# Altium project PitchShifter.PrjPcb (part 1 of 2)
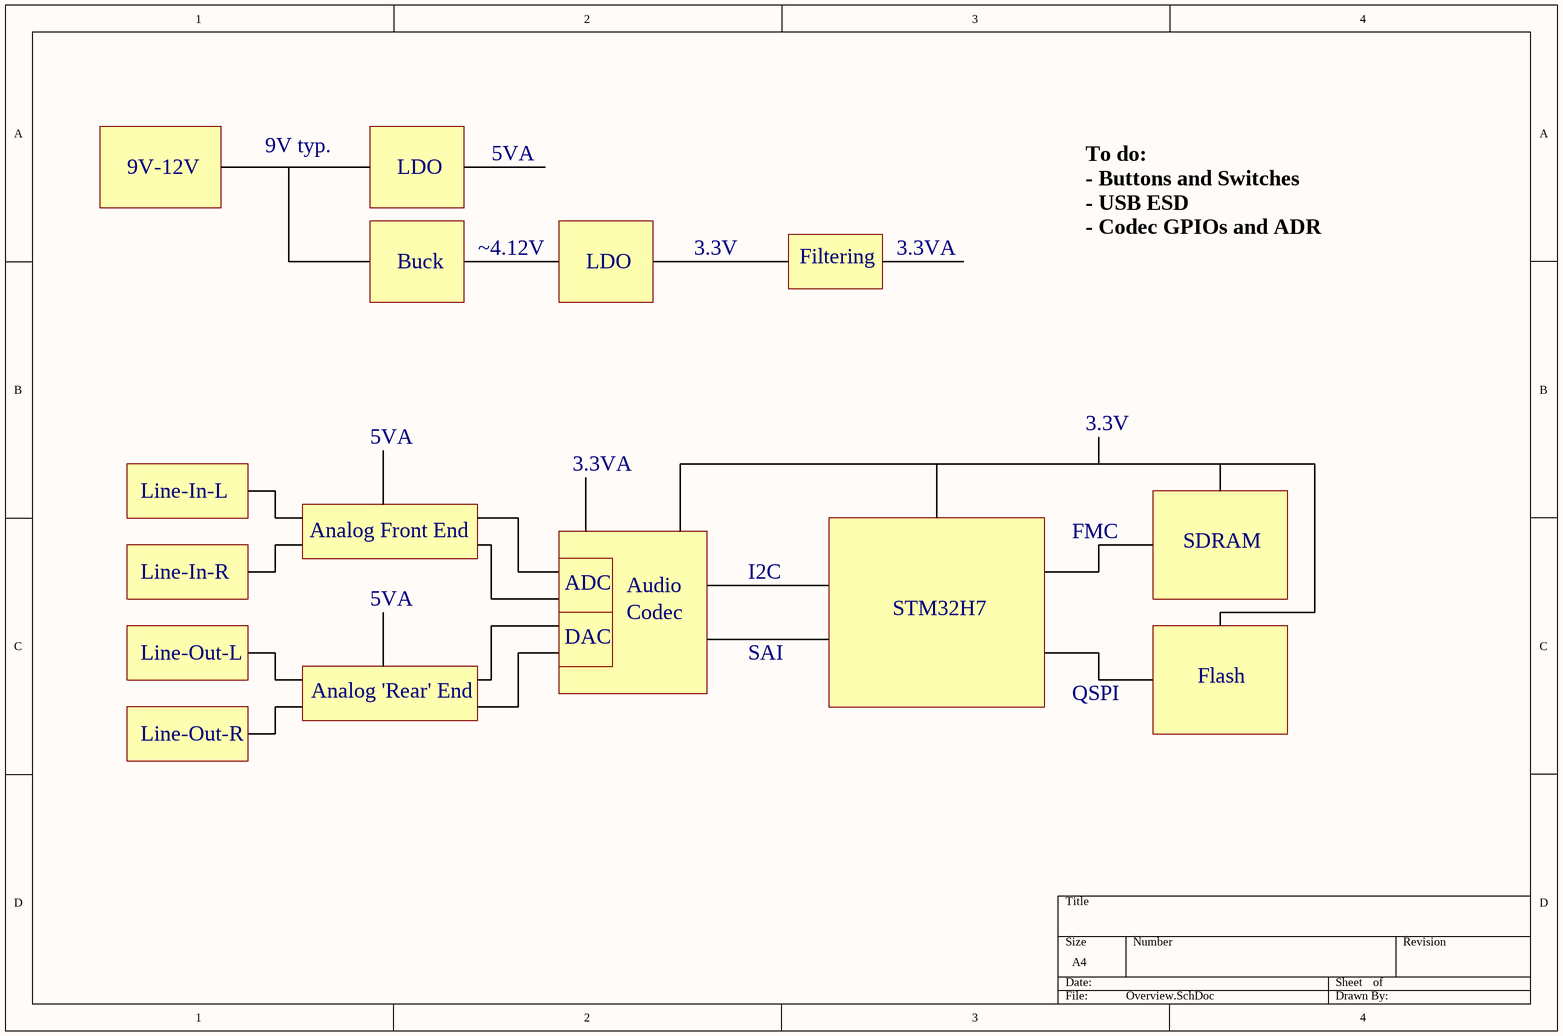
[diagram p0: Overview.SchDoc]
8 sheets, 248 parts. Net scope: global (net labels, ports and power ports of the same name join across sheets).
Board file: PitchShifter-PCB.PcbDoc
Sheets:
  Overview.SchDoc
  Analogue_IN.SchDoc
  Analogue_OUT.SchDoc
  Power.SchDoc
  MCU.SchDoc
  Codec.SchDoc
  Memory.SchDoc
  Peripherals.SchDoc

## Sheet Overview.SchDoc
size A4; SheetNumber: 1; SheetTotal: 8

### Notes on the sheet
- 9V-12V
- 9V typ.
- LDO
- 5VA
- Buck
- ~4.12V
- 3.3V
- Filtering
- 3.3VA
- To do:
  - Buttons and Switches
  - USB ESD
  - Codec GPIOs and ADR
- Line-In-L
- Line-In-R
- Analog Front End
- I2C
- FMC
- SDRAM
- ADC
- DAC
- Audio
- Codec
- STM32H7
- Line-Out-L
- Analog 'Rear' End
- SAI
- QSPI
- Flash
- Line-Out-R

## Sheet Analogue_IN.SchDoc
size A4; SheetNumber: 2; SheetTotal: 8; SPICEModelCacheHWMVXXES: <root> / <DocumentId>HWMVXXES</DocumentId> / <CacheFrame Number="0"> / <Model Name="mcp6001" Kind="CKT"> / <Text>.SUBCKT MCP6001 1 2 3 4 5 / *               | | | | | / *               | | | | Output / *               | | | Negative Supply / *               | | Positive Supply / *               | Inverting Input / *               Non-inverting Input / * / ******************************************************************************** / * Software License Agreement                                                   * / *                                                                              * / * The software supplied herewith by Microchip Technology Incorporated (the     * / * "Company") is intended and supplied to you, the Company's customer, for use  * / * soley and exclusively on Microchip products.                                 * / *                                                                              * / * The software is owned by the Company and/or its supplier, and is protected   * / * under applicable copyright laws. All rights are reserved. Any use in         * / * violation of the foregoing restrictions may subject the user to criminal     * / * sanctions under applicable laws, as well as to civil liability for the       * / * breach of the terms and conditions of this license.                          * / *                                                                              * / * THIS SOFTWARE IS PROVIDED IN AN "AS IS" CONDITION. NO WARRANTIES, WHETHER    * / * EXPRESS, IMPLIED OR STATUTORY, INCLUDING, BUT NOT LIMITED TO, IMPLIED        * / * WARRANTIES OF MERCHANTABILITY AND FITNESS FOR A PARTICULAR PURPOSE APPLY TO  * / * THIS SOFTWARE. THE COMPANY SHALL NOT, IN ANY CIRCUMSTANCES, BE LIABLE FOR    * / * SPECIAL, INCIDENTAL OR CONSEQUENTIAL DAMAGES, FOR ANY REASON WHATSOEVER.     * / ******************************************************************************** / * / * Macromodel for the MCP6001/2/4 op amp family: / *   MCP6001, MCP6001R, MCP6001U, MCP6002, MCP6004 / * / * Revision History: / *   REV A: 21-Jun-02, Created model / *   REV B: 16-Jul-02, Improved output stage / *   REV C: 03-Jan-03, Added MCP6001 / *   REV D: 19-Aug-06, Added over temperature, improved output stage, / *                     fixed overdrive recovery time / *   REV E: 27-Jul-07, Updated output impedance for better model stability w/cap load / *   REV F: 09-Jul-12, Added MCP6001R, MCP6001U / * / * Recommendations: / *   Use PSPICE (other simulators may require translation) / *   For a quick, effective design, use a combination of: data sheet / *     specs, bench testing, and simulations with this macromodel / *   For high impedance circuits, set GMIN=100F in .OPTIONS / * / * Supported: / *   Typical performance for temperature range (-40 to 125) degrees Celsius / *   DC, AC, Transient, and Noise analyses. / *   Most specs, including: offsets, DC PSRR, DC CMRR, input impedance, / *     open loop gain, voltage ranges, supply current, ... , etc. / *   Temperature effects for Ibias, Iquiescent, Iout short circuit / *   current, Vsat on both rails, Slew Rate vs. Temp and P.S. / * / * Not Supported: / *   Some Variation in specs vs. Power Supply Voltage / *   Monte Carlo (Vos, Ib), Process variation / *   Distortion (detailed non-linear behavior) / *   Behavior outside normal operating region / * / * Input Stage / V10  3 10 -500M / R10 10 11 6.90K / R11 10 12 6.90K / C11 11 12 0.2p / C12 1  0 6.00P / E12 71 14 POLY(4) 20 0 21 0 26 0 27 0   1.00M 20.1 20.1 1 1 / G12 1 0 62 0 1m / M12 11 14 15 15 NMI L=2.00U W=42.0U / M14 12  2 15 15 NMI L=2.00U W=42.0U / G14 2 0 62 0 1m / C14  2  0 6.00P / I15 15  4 50.0U / V16 16  4 -300M / GD16 16 1 TABLE {V(16,1)} ((-100,-1p)(0,0)(1m,1n)(2m,1m)(3m,1)) / V13  3 13 -300M / GD13 2 13 TABLE {V(2,13)} ((-100,-1p)(0,0)(1m,1n)(2m,1m)(3m,1)) / R70 1 0 20.6T / R71 2 0 20.6T / R72 1 2 20T / I80 1 2 0.5p / * / * Noise, PSRR, and CMRR / I20 21 20 423U / D20 20  0 DN1 / D21  0 21 DN1 / G26  0 26 POLY(1) 3 4   110U -49U / R26 26  0 1 / G27  0 27 POLY(2) 1 0 2 0   -440U 39.7U 39.7U / R27 27  0 1 / * / * Open Loop Gain, Slew Rate / G30  0 30 POLY(1) 12 11   0 1 / R30 30  0 1K / G31  0 31 POLY(1) 3 4 86 5.25 / R31 31  0 1 TC=2.8m / GD31 30 31 TABLE {V(30,31)} ((-11,-1)(-10,-10n)(0,0)(1m,1000)) / G32 32  0 POLY(1) 3 4 113.7 3.5 / R32 32  0 1 TC=2.65m / GD32 30 32 TABLE {V(30,32)} ((-1m,-1000)(0,0)(10,10n)(11,1)) / G33 0 33 30 0 1m / R33 33 0 1k / G34  0 34 33 0 425M / R34  34 0 1K / C34  34 0 74U / G37  0 37 34 0 1m / R37  37 0 1K / C37  37 0 41.6P / G38  0 38 37 0 1m / R38  39 0 1K / L38  38 39 100U / E38  35 0 38 0 1 / G35 33 0 TABLE {V(35,3)} ((-1,-1n)(0,0)(16,1n))(16.1,1)) / G36 33 0 TABLE {V(35,4)} ((-16.1,-1)((-16,-1n)(0,0)(1,1n)) / * / * Output Stage / R80 50 0 100MEG / G50 0 50 57 96 2 / R58 57  96 0.50 / R57 57  0 750 / C58  5  0 2.00P / G57  0 57 POLY(3) 3 0 4 0 35 0   0 0.67M 0.67M 1.5M / GD55 55 57 TABLE {V(55,57)} ((-2m,-1)(-1m,-1m)(0,0)(10,1n)) / GD56 57 56 TABLE {V(57,56)} ((-2m,-1)(-1m,-1m)(0,0)(10,1n)) / E55 55  0 POLY(2) 3 0 51 0 -0.7m 1 -40.0M / E56 56  0 POLY(2) 4 0 52 0 1.2m 1 -37.0M / R51 51 0 1k / R52 52 0 1k / GD51 50 51 TABLE {V(50,51)} ((-10,-1n)(0,0)(1m,1m)(2m,1)) / GD52 50 52 TABLE {V(50,52)} ((-2m,-1)(-1m,-1m)(0,0)(10,1n)) / G53  3  0 POLY(1) 51 0  -49U 1M / G54  0  4 POLY(1) 52 0  -49U -1M / * / * Current Limit / G99 96 5 99 0 1 / R98 0 98 1 TC=-2.8M,2.63U / G97 0 98 TABLE { V(96,5) } ((-11.0,-10.0M)(-1.00M,-9.9M)(0,0)(1.00M,9.9M)(11.0,10.0M)) / E97 99 0 VALUE { V(98)*((V(3)-V(4))*359M + 310M)} / D98 4 5 DESD / D99 5 3 DESD / * / * Temperature / Voltage Sensitive IQuiscent / R61 0 61 100 TC 3.11M 4.51U / G61 3 4 61 0 1 / G60 0 61 TABLE {V(3, 4)} / + ((0,0)(900M,0.0106U)(1.00,0.20U)(1.3,0.63U) / + (1.5,0.66U)(1.6,1.06U)(5.5,1.10U)) / * / * Temp Sensitive offset voltage / I73 0 70 DC 1uA / R74 0 70 1 TC=2 / E75 1 71 70 0 1 / * / * Temp Sensistive IBias / I62 0 62 DC 1uA / R62 0 62 REXP 58.2u / * Voltage on R62 used for G12, G14 in input stage / * / * Models / .MODEL NMI NMOS / .MODEL DESD  D   N=1 IS=1.00E-15 / .MODEL DL  D   N=1 IS=1F / .MODEL DN1 D   IS=1P KF=146E-18 AF=1 / .MODEL REXP RES TCE=10.1 / .ENDS MCP6001</Text> / </Model> / </CacheFrame> / </root>
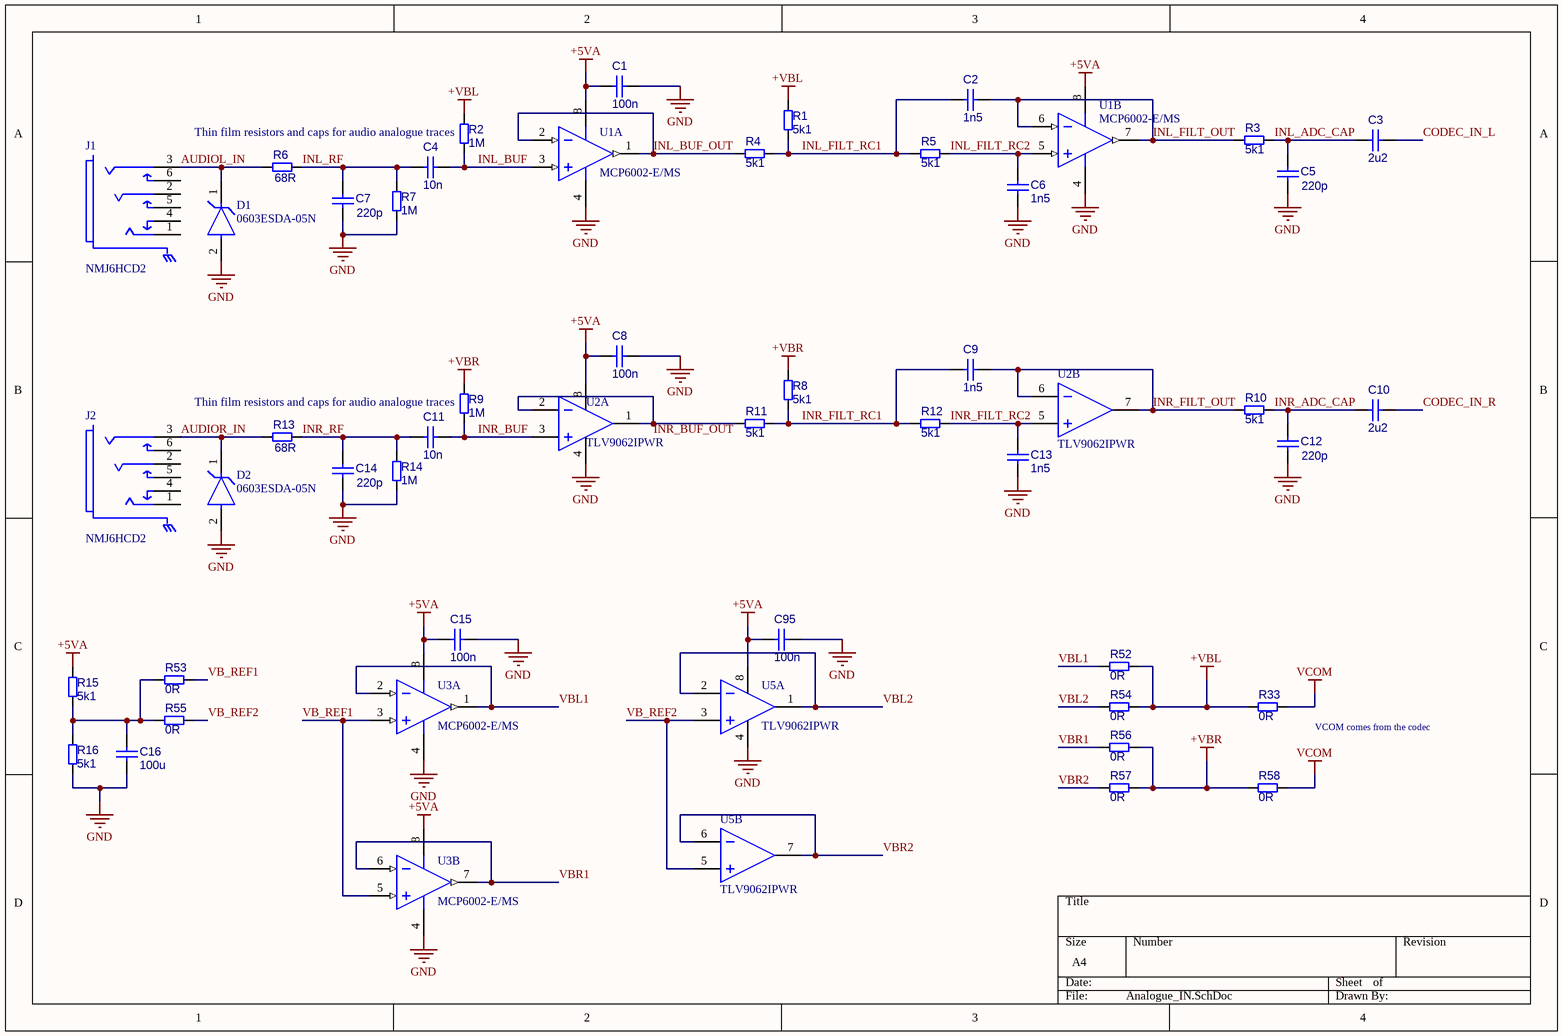
[diagram p1: Analogue_IN.SchDoc]

### Parts
C1  100n  [CAPC1005X50N_0402]
C2  1n5  [C_0402]
C3  2u2  [C_0402]
C4  10n  [C_0402]
C5  220p  [C_0402]
C6  1n5  [C_0402]
C7  220p  [C_0402]
C8  100n  [CAPC1005X50N_0402]
C9  1n5  [C_0402]
C10  2u2  [C_0402]
C11  10n  [C_0402]
C12  220p  [C_0402]
C13  1n5  [C_0402]
C14  220p  [C_0402]
C15  100n  [CAPC1005X50N_0402]
C16  100u  [C_1210]
C95  100n  [CAPC1005X50N_0402]
D1  0603ESDA-05N  [FP-1610-MFG]
D2  0603ESDA-05N  [FP-1610-MFG]
J1  NMJ6HCD2  [FP-NMJ6HCD2-MFG]
J2  NMJ6HCD2  [FP-NMJ6HCD2-MFG]
R1  5k1  [R_0603]
R2  1M  [R_0603]
R3  5k1  [R_0603]
R4  5k1  [R_0603]
R5  5k1  [R_0603]
R6  68R  [R_0603]
R7  1M  [R_0603]
R8  5k1  [R_0603]
R9  1M  [R_0603]
R10  5k1  [R_0603]
R11  5k1  [R_0603]
R12  5k1  [R_0603]
R13  68R  [R_0603]
R14  1M  [R_0603]
R15  5k1  [R_0603]
R16  5k1  [R_0603]
R33  0R  [R_0603]
R52  0R  [R_0603]
R53  0R  [R_0603]
R54  0R  [R_0603]
R55  0R  [R_0603]
R56  0R  [R_0603]
R57  0R  [R_0603]
R58  0R  [R_0603]
U1  MCP6002-E/MS  [MSOP-MS8_M]  (parts A,B of 2)
U2  TLV9062IPWR  [TSSOP-8_TLV9062IPWR]  (parts A,B of 2)
U3  MCP6002-E/MS  [MSOP-MS8_M]  (parts A,B of 2)
U5  TLV9062IPWR  [TSSOP-8_TLV9062IPWR]  (parts A,B of 2)

### Nets
+5VA: C1.1 C8.1 C15.1 C95.1 R15.2 U1.8(VDD) U2.8(-IN) U3.8(VDD) U5.8(-IN)
+VBL: R1.1 R2.2 R33.2 R52.1 R54.1
+VBR: R8.1 R9.2 R56.1 R57.1 R58.2
GND: C1.2 C5.1 C6.2 C7.1 C8.2 C12.1 C13.2 C14.1 C15.2 C16.2 C95.2 D1.2(A) D2.2(A) R7.1 R14.1 R16.1 U1.4(VSS) U2.4(-IN) U3.4(VSS) U5.4(-IN)
VCOM: R33.1 R58.1
AUDIOL_IN: D1.1(C) J1.3(S) R6.1
AUDIOR_IN: D2.1(C) J2.3(S) R13.1
CODEC_IN_L: C3.1
CODEC_IN_R: C10.1
INL_ADC_CAP: C3.2 C5.2 R3.1
INL_BUF: C4.1 R2.1 U1.3(VINA+)
INL_BUF_OUT: R4.2 U1.1(VOUTA) U1.2(VINA-)
INL_FILT_OUT: C2.1 R3.2 U1.6(VINB-) U1.7(VOUTB)
INL_FILT_RC1: C2.2 R1.2 R4.1 R5.1
INL_FILT_RC2: C6.1 R5.2 U1.5(VINB+)
INL_RF: C4.2 C7.2 R6.2 R7.2
INR_ADC_CAP: C10.2 C12.2 R10.1
INR_BUF: C11.1 R9.1 U2.3(OUT)
INR_FILT_OUT: C9.1 R10.2 U2.6(+IN) U2.7(-IN)
INR_FILT_RC1: C9.2 R8.2 R11.1 R12.1
INR_FILT_RC2: C13.1 R12.2 U2.5(OUT)
INR_RF: C11.2 C14.2 R13.2 R14.2
VB_REF1: R53.1 U3.3(VINA+) U3.5(VINB+)
VB_REF2: R55.1 U5.3(OUT) U5.5(OUT)
VBL1: R52.2 U3.1(VOUTA) U3.2(VINA-)
VBL2: R54.2 U5.1(-IN) U5.2(+IN)
VBR1: R56.2 U3.6(VINB-) U3.7(VOUTB)
VBR2: R57.2 U5.6(+IN) U5.7(-IN)
NetC16_1: C16.1 R15.1 R16.2 R53.2 R55.2
NetR11_2: R11.2 U2.1(-IN) U2.2(+IN)

Not connected (* = marked no-connect by the designer): J1 1(T) 2(R) 4(TN) 5(RN) 6(SN); J2 1(T) 2(R) 4(TN) 5(RN) 6(SN)

### Notes on the sheet
- (near R2) Thin film resistors and caps for audio analogue traces
- (near R9) Thin film resistors and caps for audio analogue traces
- (near R33) VCOM comes from the codec
- Labels drawn without touching a wire or pin: INR_BUF_OUT

### Library data of the parts
C1 C8 C15 C95 = CMP-001-00084-2: MLCC 0402 50V / Samsung CL05B104KB54PNC
C2 C6 C9 C13 = CMP-001-00085-2: MLCC 0603 50V / Samsung CL10C152JB8NNNC
C3 C10 = CMP-001-00085-2: Capacitor SMD Tantalum 0603 50V / Kyocera AVX F981C225MMA
C4 C11 = CMP-001-00085-2: MLCC 0603 50V / TDK C1608C0G1H103JT000N
C5 C7 C12 C14 = CMP-001-00085-2: MLCC 0603 50V / Samsung CL10C221JB8NNNC
C16 = CMP-001-00088-1: MLCC 1210 10V / Samsung CL32A107MQVNNNE
D1 D2 = CMP-12225-000013-1: BORN 0603ESDA-05N Diode TVS / ESD Bidirectional 0603; Manufacturer: STMicroelectronics; Manufacturer Part Number: ESDA7P60-1U1M; Number Of Channels: 1; Standoff Height: 0mm; Breakdown Voltage: 6.4V; Direction: Unidirectional; Clamping Voltage: 10.2V; Peak Pulse Power: 700W; Peak Pulse Current: 60A; Reverse Standoff Voltage: 5V; Max Junction Temp: +150°C; ComponentLink2Description: Datasheet; Temperature Range Low: -55°C; Package: 1610; Lead Free: Yes; Temperature Range High: +150°C; Temperature: -55°C to +150°C; Device Class L2: TVS Diodes; Category: Diode; Device Class L1: Circuit Protection; Digikey Description: TVS DIODE 5V 11.6V 1610; ComponentLink2URL: http://www.st.com/content/ccc/resource/technical/document/datasheet/44/e9/26/44/42/ee/4f/e5/DM00139972.pdf/files/DM00139972.pdf/jcr:content/translations/en.DM00139972.pdf; RoHS: TRUE; Octopart: https://octopart.com/esda7p60-1u1m-stmicroelectronics-52112702; Height: 0.65mm; Device Class L3: unset; Automotive: No
J1 J2 = CMP-78736-000004-1: Conn 1/4" Stereo Jack F 2 POS Solder ST Thru-Hole 6 Terminal 1 Port; Number of Ports: 1; Max Current Rating: 3A; Number of Contacts: 2; Number of Terminals/Pins: 6; Gender: Female; Voltage Rating: 50V; Contact Plating: Silver; Mount: Through Hole; RoHS Compliant: Yes; Series: M; Orientation: Horizontal; Number of Pins: 6; Weight: 0.282192oz; Housing Material: Polyamide; Depth: 18.2mm; Max Operating Temperature: 70°C; Termination: Through Hole; Color: Black; Min Operating Temperature: -25°C; Contact Material: Chrome; Package Quantity: 200
R1 R3-R5 R8 R10-R12 R15 R16 = CMP-009-00177-7: Chip THIN FILM 0603 / Viking Tech ARG03FTC5101
R2 R7 R9 R14 = CMP-009-00177-7: Chip THIN FILM 0603 / Viking Tech AR03FTC1004
R6 R13 = CMP-009-00177-7: Chip THIN FILM 0603 / Resistor.Today HPCR0603F68R0K9
R33 R52-R58 = CMP-009-00177-7: Chip 0603
U1 U3 = CMP-0187-00576-3: None; Nominal Supply Current: 100uA; Max Supply Voltage: 6V; Amplifier Type: GENERAL PURPOSE; Output Current: 23mA; Gain Bandwidth Product: 1MHz; Number of Channels: 2; Power Supply Rejection Ratio (PSRR): 86dB; Min Supply Voltage: 1.8V; Input Bias Current: 1pA; Input Offset Voltage (Vos): 4.5mV; Operating Supply Voltage: 5.5V; Slew Rate-Nom: 0.6V/µs; Common Mode Rejection Ratio: 60dB; Voltage Gain: 112dB; Mount: Surface Mount; Case/Package: MSOP; Lead Free: Lead Free; Width: 3mm; Radiation Hardening: No; Technology: CMOS; Number of Pins: 8; Supply Current: 100uA; Height: 0.95mm; Number of Elements: 2; Min Operating Temperature: -40°C; Package Quantity: 100; Packaging: Rail/Tube; Max Operating Temperature: 125°C; Slew Rate: 0.6V/µs; RoHS Compliant: Yes; Input Offset Voltage-Max: 4.5mV; Number of Amplifiers: 2; Length: 3mm; Unity Gain Bandwidth Product: 1MHz; REACH SVHC: No SVHC; Bandwidth: 1MHz; Number of Circuits: 2
U2 U5 = CMP-014-00002-2: Dual, 5.5-V, 10-MHz operational amplifier 8-TSSOP -40 to 125; Manufacturer Lifecycle Status: ACTIVE; Bandwidth: 10MHz; Number of Channels: 2; Slew Rate: 6.5V/µs; Length: 3mm; Max Operating Temperature: 125°C; RoHS: Compliant; Height: 1.2mm; Case/Package: TSSOP; Pins: 8; Width: 4.4mm; Min Operating Temperature: -40°C; Thickness: 1mm; Lifecycle Status: Production; PartId: 1

## Sheet Analogue_OUT.SchDoc
size A4; SheetNumber: 3; SheetTotal: 8; SPICEModelCacheSMTEWOYN: <root> / <DocumentId>SMTEWOYN</DocumentId> / <CacheFrame Number="0"> / <Model Name="mcp6001" Kind="CKT"> / <Text>.SUBCKT MCP6001 1 2 3 4 5 / *               | | | | | / *               | | | | Output / *               | | | Negative Supply / *               | | Positive Supply / *               | Inverting Input / *               Non-inverting Input / * / ******************************************************************************** / * Software License Agreement                                                   * / *                                                                              * / * The software supplied herewith by Microchip Technology Incorporated (the     * / * "Company") is intended and supplied to you, the Company's customer, for use  * / * soley and exclusively on Microchip products.                                 * / *                                                                              * / * The software is owned by the Company and/or its supplier, and is protected   * / * under applicable copyright laws. All rights are reserved. Any use in         * / * violation of the foregoing restrictions may subject the user to criminal     * / * sanctions under applicable laws, as well as to civil liability for the       * / * breach of the terms and conditions of this license.                          * / *                                                                              * / * THIS SOFTWARE IS PROVIDED IN AN "AS IS" CONDITION. NO WARRANTIES, WHETHER    * / * EXPRESS, IMPLIED OR STATUTORY, INCLUDING, BUT NOT LIMITED TO, IMPLIED        * / * WARRANTIES OF MERCHANTABILITY AND FITNESS FOR A PARTICULAR PURPOSE APPLY TO  * / * THIS SOFTWARE. THE COMPANY SHALL NOT, IN ANY CIRCUMSTANCES, BE LIABLE FOR    * / * SPECIAL, INCIDENTAL OR CONSEQUENTIAL DAMAGES, FOR ANY REASON WHATSOEVER.     * / ******************************************************************************** / * / * Macromodel for the MCP6001/2/4 op amp family: / *   MCP6001, MCP6001R, MCP6001U, MCP6002, MCP6004 / * / * Revision History: / *   REV A: 21-Jun-02, Created model / *   REV B: 16-Jul-02, Improved output stage / *   REV C: 03-Jan-03, Added MCP6001 / *   REV D: 19-Aug-06, Added over temperature, improved output stage, / *                     fixed overdrive recovery time / *   REV E: 27-Jul-07, Updated output impedance for better model stability w/cap load / *   REV F: 09-Jul-12, Added MCP6001R, MCP6001U / * / * Recommendations: / *   Use PSPICE (other simulators may require translation) / *   For a quick, effective design, use a combination of: data sheet / *     specs, bench testing, and simulations with this macromodel / *   For high impedance circuits, set GMIN=100F in .OPTIONS / * / * Supported: / *   Typical performance for temperature range (-40 to 125) degrees Celsius / *   DC, AC, Transient, and Noise analyses. / *   Most specs, including: offsets, DC PSRR, DC CMRR, input impedance, / *     open loop gain, voltage ranges, supply current, ... , etc. / *   Temperature effects for Ibias, Iquiescent, Iout short circuit / *   current, Vsat on both rails, Slew Rate vs. Temp and P.S. / * / * Not Supported: / *   Some Variation in specs vs. Power Supply Voltage / *   Monte Carlo (Vos, Ib), Process variation / *   Distortion (detailed non-linear behavior) / *   Behavior outside normal operating region / * / * Input Stage / V10  3 10 -500M / R10 10 11 6.90K / R11 10 12 6.90K / C11 11 12 0.2p / C12 1  0 6.00P / E12 71 14 POLY(4) 20 0 21 0 26 0 27 0   1.00M 20.1 20.1 1 1 / G12 1 0 62 0 1m / M12 11 14 15 15 NMI L=2.00U W=42.0U / M14 12  2 15 15 NMI L=2.00U W=42.0U / G14 2 0 62 0 1m / C14  2  0 6.00P / I15 15  4 50.0U / V16 16  4 -300M / GD16 16 1 TABLE {V(16,1)} ((-100,-1p)(0,0)(1m,1n)(2m,1m)(3m,1)) / V13  3 13 -300M / GD13 2 13 TABLE {V(2,13)} ((-100,-1p)(0,0)(1m,1n)(2m,1m)(3m,1)) / R70 1 0 20.6T / R71 2 0 20.6T / R72 1 2 20T / I80 1 2 0.5p / * / * Noise, PSRR, and CMRR / I20 21 20 423U / D20 20  0 DN1 / D21  0 21 DN1 / G26  0 26 POLY(1) 3 4   110U -49U / R26 26  0 1 / G27  0 27 POLY(2) 1 0 2 0   -440U 39.7U 39.7U / R27 27  0 1 / * / * Open Loop Gain, Slew Rate / G30  0 30 POLY(1) 12 11   0 1 / R30 30  0 1K / G31  0 31 POLY(1) 3 4 86 5.25 / R31 31  0 1 TC=2.8m / GD31 30 31 TABLE {V(30,31)} ((-11,-1)(-10,-10n)(0,0)(1m,1000)) / G32 32  0 POLY(1) 3 4 113.7 3.5 / R32 32  0 1 TC=2.65m / GD32 30 32 TABLE {V(30,32)} ((-1m,-1000)(0,0)(10,10n)(11,1)) / G33 0 33 30 0 1m / R33 33 0 1k / G34  0 34 33 0 425M / R34  34 0 1K / C34  34 0 74U / G37  0 37 34 0 1m / R37  37 0 1K / C37  37 0 41.6P / G38  0 38 37 0 1m / R38  39 0 1K / L38  38 39 100U / E38  35 0 38 0 1 / G35 33 0 TABLE {V(35,3)} ((-1,-1n)(0,0)(16,1n))(16.1,1)) / G36 33 0 TABLE {V(35,4)} ((-16.1,-1)((-16,-1n)(0,0)(1,1n)) / * / * Output Stage / R80 50 0 100MEG / G50 0 50 57 96 2 / R58 57  96 0.50 / R57 57  0 750 / C58  5  0 2.00P / G57  0 57 POLY(3) 3 0 4 0 35 0   0 0.67M 0.67M 1.5M / GD55 55 57 TABLE {V(55,57)} ((-2m,-1)(-1m,-1m)(0,0)(10,1n)) / GD56 57 56 TABLE {V(57,56)} ((-2m,-1)(-1m,-1m)(0,0)(10,1n)) / E55 55  0 POLY(2) 3 0 51 0 -0.7m 1 -40.0M / E56 56  0 POLY(2) 4 0 52 0 1.2m 1 -37.0M / R51 51 0 1k / R52 52 0 1k / GD51 50 51 TABLE {V(50,51)} ((-10,-1n)(0,0)(1m,1m)(2m,1)) / GD52 50 52 TABLE {V(50,52)} ((-2m,-1)(-1m,-1m)(0,0)(10,1n)) / G53  3  0 POLY(1) 51 0  -49U 1M / G54  0  4 POLY(1) 52 0  -49U -1M / * / * Current Limit / G99 96 5 99 0 1 / R98 0 98 1 TC=-2.8M,2.63U / G97 0 98 TABLE { V(96,5) } ((-11.0,-10.0M)(-1.00M,-9.9M)(0,0)(1.00M,9.9M)(11.0,10.0M)) / E97 99 0 VALUE { V(98)*((V(3)-V(4))*359M + 310M)} / D98 4 5 DESD / D99 5 3 DESD / * / * Temperature / Voltage Sensitive IQuiscent / R61 0 61 100 TC 3.11M 4.51U / G61 3 4 61 0 1 / G60 0 61 TABLE {V(3, 4)} / + ((0,0)(900M,0.0106U)(1.00,0.20U)(1.3,0.63U) / + (1.5,0.66U)(1.6,1.06U)(5.5,1.10U)) / * / * Temp Sensitive offset voltage / I73 0 70 DC 1uA / R74 0 70 1 TC=2 / E75 1 71 70 0 1 / * / * Temp Sensistive IBias / I62 0 62 DC 1uA / R62 0 62 REXP 58.2u / * Voltage on R62 used for G12, G14 in input stage / * / * Models / .MODEL NMI NMOS / .MODEL DESD  D   N=1 IS=1.00E-15 / .MODEL DL  D   N=1 IS=1F / .MODEL DN1 D   IS=1P KF=146E-18 AF=1 / .MODEL REXP RES TCE=10.1 / .ENDS MCP6001</Text> / </Model> / </CacheFrame> / </root>
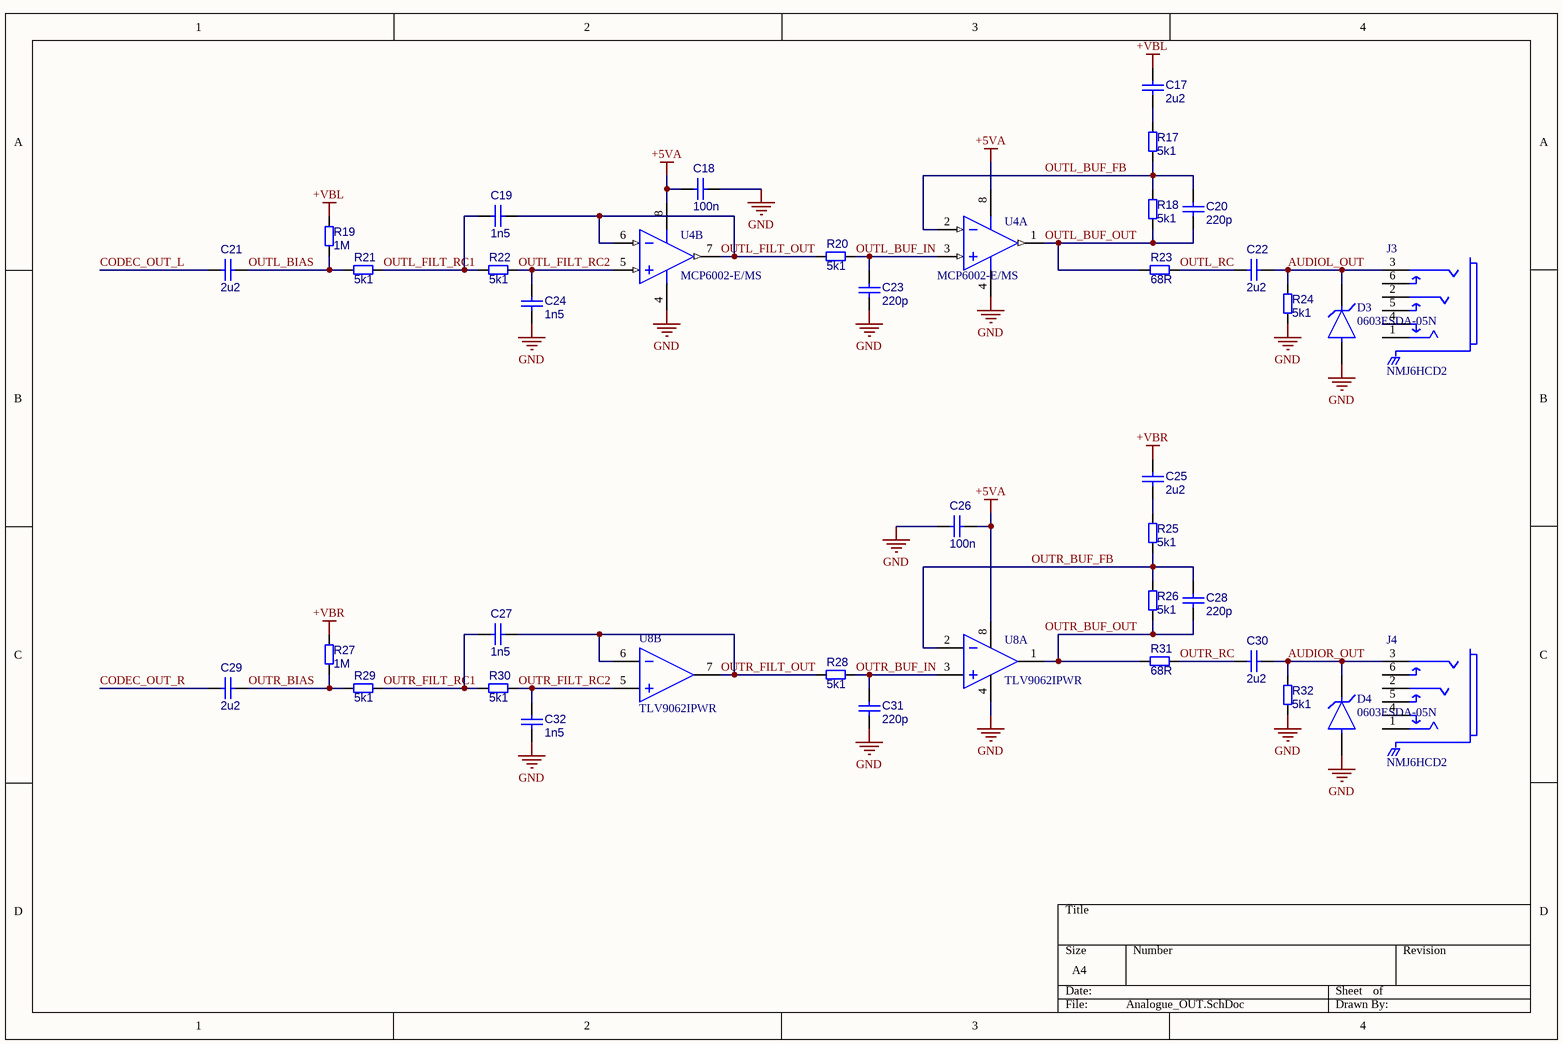
[diagram p2: Analogue_OUT.SchDoc]

### Parts
C17  2u2  [C_0402]
C18  100n  [CAPC1005X50N_0402]
C19  1n5  [C_0402]
C20  220p  [C_0402]
C21  2u2  [C_0402]
C22  2u2  [C_0402]
C23  220p  [C_0402]
C24  1n5  [C_0402]
C25  2u2  [C_0402]
C26  100n  [CAPC1005X50N_0402]
C27  1n5  [C_0402]
C28  220p  [C_0402]
C29  2u2  [C_0402]
C30  2u2  [C_0402]
C31  220p  [C_0402]
C32  1n5  [C_0402]
D3  0603ESDA-05N  [FP-1610-MFG]
D4  0603ESDA-05N  [FP-1610-MFG]
J3  NMJ6HCD2  [FP-NMJ6HCD2-MFG]
J4  NMJ6HCD2  [FP-NMJ6HCD2-MFG]
R17  5k1  [R_0603]
R18  5k1  [R_0603]
R19  1M  [R_0603]
R20  5k1  [R_0603]
R21  5k1  [R_0603]
R22  5k1  [R_0603]
R23  68R  [R_0603]
R24  5k1  [R_0603]
R25  5k1  [R_0603]
R26  5k1  [R_0603]
R27  1M  [R_0603]
R28  5k1  [R_0603]
R29  5k1  [R_0603]
R30  5k1  [R_0603]
R31  68R  [R_0603]
R32  5k1  [R_0603]
U4  MCP6002-E/MS  [MSOP-MS8_M]  (parts A,B of 2)
U8  TLV9062IPWR  [TSSOP-8_TLV9062IPWR]  (parts A,B of 2)

### Nets
+5VA: C18.1 C26.1 U4.8(VDD) U8.8(-IN)
+VBL: C17.1 R19.2
+VBR: C25.1 R27.2
GND: C18.2 C23.1 C24.1 C26.2 C31.1 C32.1 D3.2(A) D4.2(A) R24.1 R32.1 U4.4(VSS) U8.4(-IN)
AUDIOL_OUT: C22.2 D3.1(C) J3.3(S) R24.2
AUDIOR_OUT: C30.2 D4.1(C) J4.3(S) R32.2
CODEC_OUT_L: C21.2
CODEC_OUT_R: C29.2
OUTL_BIAS: C21.1 R19.1 R21.1
OUTL_BUF_FB: C20.1 R17.1 R18.2 U4.2(VINA-)
OUTL_BUF_IN: C23.2 R20.2 U4.3(VINA+)
OUTL_BUF_OUT: C20.2 R18.1 R23.1 U4.1(VOUTA)
OUTL_FILT_OUT: C19.2 R20.1 U4.6(VINB-) U4.7(VOUTB)
OUTL_FILT_RC1: C19.1 R21.2 R22.1
OUTL_FILT_RC2: C24.2 R22.2 U4.5(VINB+)
OUTL_RC: C22.1 R23.2
OUTR_BIAS: C29.1 R27.1 R29.1
OUTR_BUF_FB: C28.1 R25.1 R26.2 U8.2(+IN)
OUTR_BUF_IN: C31.2 R28.2 U8.3(OUT)
OUTR_FILT_OUT: C27.2 R28.1 U8.6(+IN) U8.7(-IN)
OUTR_FILT_RC1: C27.1 R29.2 R30.1
OUTR_FILT_RC2: C32.2 R30.2 U8.5(OUT)
OUTR_RC: C30.1 R31.2
NetC17_2: C17.2 R17.2
NetC25_2: C25.2 R25.2
NetC28_2: C28.2 R26.1 R31.1 U8.1(-IN)

Not connected (* = marked no-connect by the designer): J3 1(T) 2(R) 4(TN) 5(RN) 6(SN); J4 1(T) 2(R) 4(TN) 5(RN) 6(SN)

### Notes on the sheet
- Labels drawn without touching a wire or pin: OUTR_BUF_OUT

### Library data of the parts
C17 C21 C22 C25 C29 C30 = CMP-001-00085-2: as C3 on sheet Analogue_IN
C18 C26 = CMP-001-00084-2: MLCC 0402 50V / Samsung CL05B104KB54PNC
C19 C24 C27 C32 = CMP-001-00085-2: MLCC 0603 50V / Samsung CL10C152JB8NNNC
C20 C23 C28 C31 = CMP-001-00085-2: MLCC 0603 50V / Samsung CL10C221JB8NNNC
D3 D4 = CMP-12225-000013-1: as D1 on sheet Analogue_IN; ComponentLink2Description: Datasheet; Temperature Range Low: -55°C; Package: 1610; Lead Free: Yes; Temperature Range High: +150°C; Temperature: -55°C to +150°C; Device Class L2: TVS Diodes; Category: Diode; Device Class L1: Circuit Protection; Digikey Description: TVS DIODE 5V 11.6V 1610; ComponentLink2URL: http://www.st.com/content/ccc/resource/technical/document/datasheet/44/e9/26/44/42/ee/4f/e5/DM00139972.pdf/files/DM00139972.pdf/jcr:content/translations/en.DM00139972.pdf; RoHS: TRUE; Octopart: https://octopart.com/esda7p60-1u1m-stmicroelectronics-52112702; Height: 0.65mm; Device Class L3: unset; Automotive: No
J3 J4 = CMP-78736-000004-1: as J1 on sheet Analogue_IN; Contact Plating: Silver; Mount: Through Hole; RoHS Compliant: Yes; Series: M; Orientation: Horizontal; Number of Pins: 6; Weight: 0.282192oz; Housing Material: Polyamide; Depth: 18.2mm; Max Operating Temperature: 70°C; Termination: Through Hole; Color: Black; Min Operating Temperature: -25°C; Contact Material: Chrome; Package Quantity: 200
R17 R18 R20-R22 R24-R26 R28-R30 R32 = CMP-009-00177-7: as R1 on sheet Analogue_IN
R19 R27 = CMP-009-00177-7: as R2 on sheet Analogue_IN
R23 R31 = CMP-009-00177-7: as R6 on sheet Analogue_IN
U4 = CMP-0187-00576-3: as U1 on sheet Analogue_IN; Mount: Surface Mount; Case/Package: MSOP; Lead Free: Lead Free; Width: 3mm; Radiation Hardening: No; Technology: CMOS; Number of Pins: 8; Supply Current: 100uA; Height: 0.95mm; Number of Elements: 2; Min Operating Temperature: -40°C; Package Quantity: 100; Packaging: Rail/Tube; Max Operating Temperature: 125°C; Slew Rate: 0.6V/µs; RoHS Compliant: Yes; Input Offset Voltage-Max: 4.5mV; Number of Amplifiers: 2; Length: 3mm; Unity Gain Bandwidth Product: 1MHz; REACH SVHC: No SVHC; Bandwidth: 1MHz; Number of Circuits: 2
U8 = CMP-014-00002-2: as U2 on sheet Analogue_IN; Length: 3mm; Max Operating Temperature: 125°C; RoHS: Compliant; Height: 1.2mm; Case/Package: TSSOP; Pins: 8; Width: 4.4mm; Min Operating Temperature: -40°C; Thickness: 1mm; Lifecycle Status: Production; PartId: 1

## Sheet Power.SchDoc
size A4; SheetNumber: 4; SheetTotal: 8
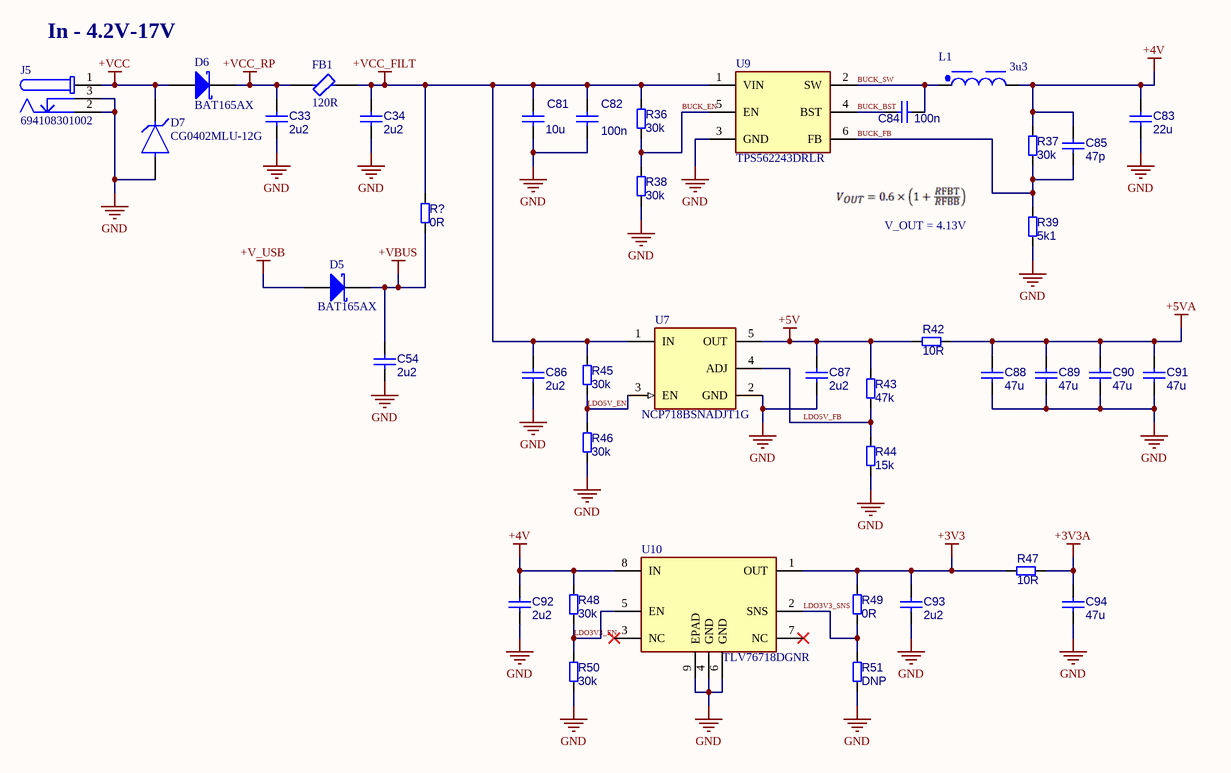
[diagram p3: Power.SchDoc]

### Parts
C33  2u2  [C_0402]
C34  2u2  [C_0402]
C54  2u2  [C_0402]
C81  10u  [C_0805]
C82  100n  [CAPC1005X50N_0402]
C83  22u  [C_0805]
C84  100n  [CAPC1005X50N_0402]
C85  47p  [C_0805]
C86  2u2  [C_0402]
C87  2u2  [C_0402]
C88  47u  [C_1210]
C89  47u  [C_1210]
C90  47u  [C_1210]
C91  47u  [C_1210]
C92  2u2  [C_0402]
C93  2u2  [C_0402]
C94  47u  [C_1210]
D5  BAT165AX  [JCET-SMB-2_M]
D6  BAT165AX  [JCET-SMB-2_M]
D7  CG0402MLU-12G  [FP-1610-MFG]
FB1  120R  [FP-NFZ32BW-w2_8-MFG]
J5  694108301002  [694108301002]
L1  3u3  [WE-XHMI_4030]
R36  30k  [R_0603]
R37  30k  [R_0603]
R38  30k  [R_0603]
R39  5k1  [R_0603]
R42  10R  [R_0603]
R43  47k  [R_0603]
R44  15k  [R_0603]
R45  30k  [R_0603]
R46  30k  [R_0603]
R47  10R  [R_0603]
R48  30k  [R_0603]
R49  0R  [R_0603]
R50  30k  [R_0603]
R51  DNP  [R_0603]
R?  0R  [R_0603]
U7  NCP718BSNADJT1G  [FP-419AE-01-IPC_C]
U9  TPS562243DRLR  [SOT-563-6_TPS56224]
U10  TLV76718DGNR  [HVSSOP-8-PowerPAD_TLV767]

### Nets
+3V3: C93.1 R47.1 R49.2 U10.1(OUT)
+3V3A: C94.2 R47.2
+4V: C83.1 C85.1 C92.1 L1.2 R37.1 R48.1 U10.8(IN)
+5V: C87.1 R42.1 R43.1 U7.5(OUT)
+5VA: C88.2 C89.2 C90.2 C91.2 R42.2
+V_USB: D5.1(A)
+VBUS: C54.1 D5.2(K) R?.2
+VCC: D6.1(A) D7.1(C) J5.1
+VCC_FILT: C34.1 C81.2 C82.1 C86.1 FB1.2 R36.1 R45.1 R?.1 U7.1(IN) U9.1(VIN)
+VCC_RP: C33.1 D6.2(K) FB1.1
GND: C33.2 C34.2 C54.2 C81.1 C82.2 C83.2 C86.2 C87.2 C88.1 C89.1 C90.1 C91.1 C92.2 C93.2 C94.1 D7.2(A) J5.2 J5.3 R38.2 R39.2 R44.2 R46.2 R50.2 R51.1 U7.2(GND) U9.3(GND) U10.4(GND) U10.6(GND) U10.9(EPAD)
BUCK_BST: C84.2 U9.4(BST)
BUCK_EN: R36.2 R38.1 U9.5(EN)
BUCK_FB: C85.2 R37.2 R39.1 U9.6(FB)
BUCK_SW: C84.1 L1.1 U9.2(SW)
LDO3V3_EN: R48.2 R50.1 U10.5(EN)
LDO3V3_SNS: R49.1 R51.2 U10.2(SNS)
LDO5V_EN: R45.2 R46.1 U7.3(EN)
LDO5V_FB: R43.2 R44.1 U7.4(ADJ)

Not connected (* = marked no-connect by the designer): U10 3(NC)* 7(NC)*

### Notes on the sheet
- In - 4.2V-17V
- V_OUT = 4.13V

### Library data of the parts
C33 C34 C54 C86 C87 C92 C93 = CMP-001-00085-2: as C3 on sheet Analogue_IN
C81 C83 C85 = CMP-001-00086-2: MLCC 0805
C82 C84 = CMP-001-00084-2: MLCC 0402 50V / Samsung CL05B104KB54PNC
C88-C91 C94 = CMP-001-00088-1: 1210, X5R:EIA, 100uF, DC6.3V, GRM32ER60J107ME20
D5 D6 = CMP-004-00006-2: Nexperia BAT165AX / Rectifier Diode, Schottky, 1 Phase, 1 Element, 0.5A, 40V V(RRM), Silicon; Manufacturer: JCET; Datasheet URL: http://wiki.seeedstudio.com/images/3/3f/0310130P1.pdf; Datasheet Version: May-13; Package Reference: SMB-2; RoHS Compliant: Unknown; Manufacturer URL: http://www.cj-elec.com/; Mounting Technology: SM; Package Description: 2-Pin Surface Mount Device, Body 4.315 x 3.62 mm; Case/Package: SMB-2
D7 = CMP-12225-000013-1: Bourns CG0402MLU-12G / ESD Protection Device, 25 V, 0402 [1005 Metric], 2 Pins, 12 V, 0.05 pF, ChipGuard MLU; Manufacturer: STMicroelectronics; Manufacturer Part Number: ESDA7P60-1U1M; Number Of Channels: 1; Standoff Height: 0mm; Breakdown Voltage: 6.4V; Direction: Unidirectional; Clamping Voltage: 10.2V; Peak Pulse Power: 700W; Peak Pulse Current: 60A; Reverse Standoff Voltage: 5V; Max Junction Temp: +150°C; ComponentLink2Description: Datasheet; Temperature Range Low: -55°C; Package: 1610; Lead Free: Yes; Temperature Range High: +150°C; Temperature: -55°C to +150°C; Device Class L2: TVS Diodes; Category: Diode; Device Class L1: Circuit Protection; Digikey Description: TVS DIODE 5V 11.6V 1610; ComponentLink2URL: http://www.st.com/content/ccc/resource/technical/document/datasheet/44/e9/26/44/42/ee/4f/e5/DM00139972.pdf/files/DM00139972.pdf/jcr:content/translations/en.DM00139972.pdf; RoHS: TRUE; Octopart: https://octopart.com/esda7p60-1u1m-stmicroelectronics-52112702; Height: 0.65mm; Device Class L3: unset; Automotive: No
FB1 = CMP-06046-002300-1: Ferrite Bead 3.6Ω @ 1MHz ±30% 2.55A 0.036Ω 1210 Embossed T/R
J5 = CMP-1502-00190-4: DC Power Jack Connector WR-DC, Male, Right Angled, THT, 5 A, 24 V; Operating Supply Voltage: 24V; Shielding: Unshielded; Voltage Rating: 30V; Number of Contacts: 3; Insulation Resistance: 100MΩ; Current Rating: 5A; Min Operating Temperature: -40°C; Packaging: Bulk; Connector Type: Power; Housing Material: Polyamide; REACH SVHC: Unknown; Termination: Through Hole; Contact Gender: Female; Mount: Through Hole; RoHS: Compliant; Flammability Rating: UL94 V-0; Height: 11mm; Max Operating Temperature: 85°C; Contact Plating: Tin; Color: Black; Gender: Male; Contact Material: Gold, Tin
L1 = CMP-03913-148605656-1: Power Inductor, 3.3UH, Shielded, 7.1A Rohs Compliant: Yes / Wurth 74439324033; ComponentLink1Description: Mauser; ComponentLink1URL: https://eu.mouser.com/en/ProductDetail/Wurth-Elektronik/74439324033?qs=HFfMDpzxxd18KH4wt4XmSg%3D%3D
R36-R39 R42-R51 R? = CMP-009-00177-7: Chip resistor 0603
U7 = CMP-07128-000004-1: 300 MA LOW IQ WIDE INPUT; Manufacturer: On Semiconductor; Max Supply Voltage: 24V; Output Type: AdjustableProgrammable; Min Supply Voltage: 2.5V; Max Junction Temp: +125°C; Nominal Supply Current: 50-300uA; Dropout Voltage: 480mV; Accuracy Percentage: 2%; Standoff Height: 0.01mm; Output Voltage: 1.2-5V; Number Of Outputs: 1; Output Current: 300mA; Lead Free: Yes; Temperature: to +125°C; ComponentLink2URL: https://www.onsemi.com/pub/Collateral/NCP718-D.PDF; Height: 1mm; ComponentLink2Description: Datasheet; Octopart: https://octopart.com/ncp718bsnadjt1g-on+semiconductor-87658781; Manufacturer Part Number: NCP718BSNADJT1G; Device Class L1: Integrated Circuits (ICs); Device Class L2: Power Management ICs; Device Class L3: Voltage Regulators - Linear; Digikey Description: 300 MA LOW IQ WIDE INPUT; Temperature Range High: +125°C; Package: 419AE-01; Mouser Description: LDO Regulator, 300 mA, Wide Vin, Ultra-Low Iq Adjustable, Non-Active Discharge, TSOT23-5; Category: IC; Automotive: No; RoHS: TRUE; ComponentLink3Description: Mauser; ComponentLink3URL: https://eu.mouser.com/en/ProductDetail/onsemi/NCP718BSNADJT1G?qs=MLItCLRbWszq%252BMkbDp%2FijQ%3D%3D
U9 = CMP-019-00067-2: 4.2V to 17V input voltage, 2A, 1.2MHz synchronous buck converter in SOT563 with Eco-mode 6-SOT-5X3 -40 to 125; Manufacturer Lifecycle Status: ACTIVE; Width: 1.2mm; Height: 600µm; Topology: Buck; RoHS: Compliant; Thickness: 550µm; Length: 1.6mm; Lifecycle Status: Production; Pins: 6
U10 = CMP-019-00068-2: Adjustable- and fixed-output, 1-A, 16-V, positive-voltage low-dropout (LDO) linear regulator; Manufacturer Lifecycle Status: ACTIVE; Output Voltage: 1.8V; Number of Channels: 1; Width: 3mm; Lifecycle Status: Production; Thickness: 1.02mm; Length: 3mm; Pins: 8; RoHS: Compliant; Height: 1.1mm

## Sheet MCU.SchDoc
size A4; SheetNumber: 5; SheetTotal: 8
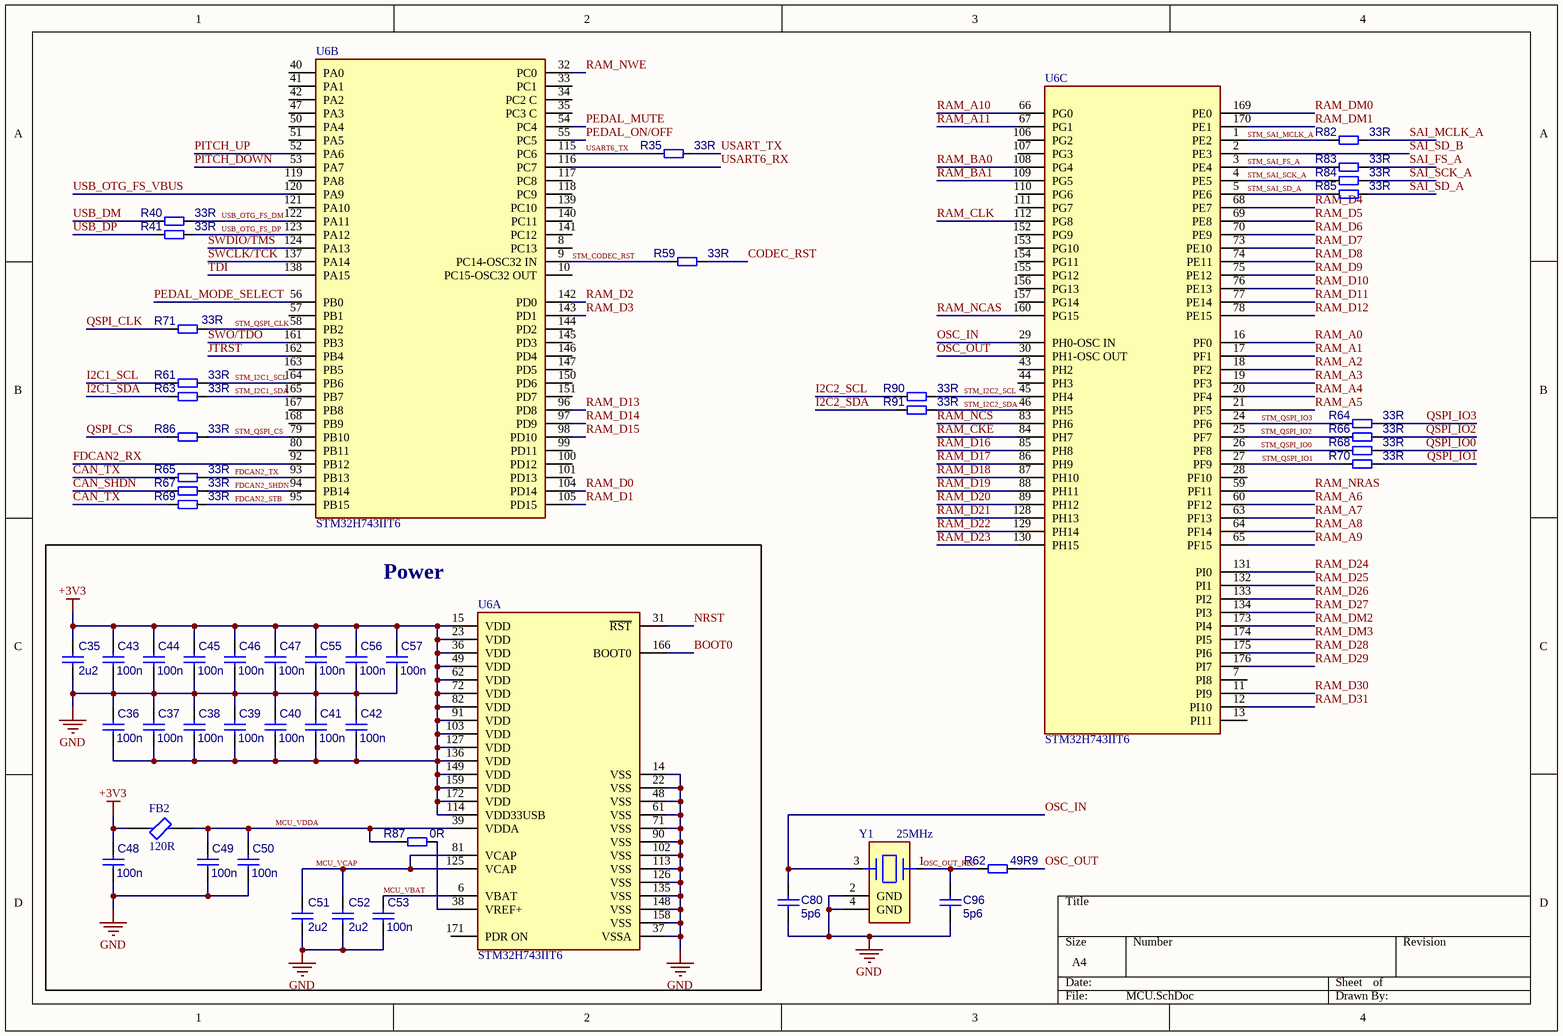
[diagram p4: MCU.SchDoc]

### Parts
C35  2u2  [C_0402]
C36  100n  [CAPC1005X50N_0402]
C37  100n  [CAPC1005X50N_0402]
C38  100n  [CAPC1005X50N_0402]
C39  100n  [CAPC1005X50N_0402]
C40  100n  [CAPC1005X50N_0402]
C41  100n  [CAPC1005X50N_0402]
C42  100n  [CAPC1005X50N_0402]
C43  100n  [CAPC1005X50N_0402]
C44  100n  [CAPC1005X50N_0402]
C45  100n  [CAPC1005X50N_0402]
C46  100n  [CAPC1005X50N_0402]
C47  100n  [CAPC1005X50N_0402]
C48  100n  [CAPC1005X50N_0402]
C49  100n  [CAPC1005X50N_0402]
C50  100n  [CAPC1005X50N_0402]
C51  2u2  [C_0402]
C52  2u2  [C_0402]
C53  100n  [CAPC1005X50N_0402]
C55  100n  [CAPC1005X50N_0402]
C56  100n  [CAPC1005X50N_0402]
C57  100n  [CAPC1005X50N_0402]
C80  5p6  [CAPC1005X50N_0402]
C96  5p6  [CAPC1005X50N_0402]
FB2  120R  [FP-NFZ32BW-w2_8-MFG]
R35  33R  [R_0402]
R40  33R  [R_0402]
R41  33R  [R_0402]
R59  33R  [R_0402]
R61  33R  [R_0402]
R62  49R9  [R_0402]
R63  33R  [R_0402]
R64  33R  [R_0402]
R65  33R  [R_0402]
R66  33R  [R_0402]
R67  33R  [R_0402]
R68  33R  [R_0402]
R69  33R  [R_0402]
R70  33R  [R_0402]
R71  33R  [R_0402]
R82  33R  [R_0402]
R83  33R  [R_0402]
R84  33R  [R_0402]
R85  33R  [R_0402]
R86  33R  [R_0402]
R87  0R  [R_0402]
R90  33R  [R_0402]
R91  33R  [R_0402]
U6  STM32H743IIT6  [FP-LQFP176-1T-MFG]  (parts A,B,C of 3)
Y1  25MHz  [FP-NX2016SA-MFG]

### Blocks framed on the sheet
Power: C35-C53 C55-C57 FB2 R87 U6

### Nets
+3V3: C35.1 C36.2 C37.2 C38.2 C39.2 C40.2 C41.2 C42.2 C43.1 C44.1 C45.1 C46.1 C47.1 C48.1 C55.1 C56.1 C57.1 FB2.1 U6.15(VDD) U6.23(VDD) U6.36(VDD) U6.49(VDD) U6.62(VDD) U6.72(VDD) U6.82(VDD) U6.91(VDD) U6.103(VDD) U6.114(VDD33USB) U6.127(VDD) U6.136(VDD) U6.149(VDD) U6.159(VDD) U6.172(VDD)
GND: C35.2 C36.1 C37.1 C38.1 C39.1 C40.1 C41.1 C42.1 C43.2 C44.2 C45.2 C46.2 C47.2 C48.2 C49.2 C50.2 C51.2 C52.2 C53.2 C55.2 C56.2 C57.2 C80.2 C96.1 U6.14(VSS) U6.22(VSS) U6.37(VSSA) U6.48(VSS) U6.61(VSS) U6.71(VSS) U6.90(VSS) U6.102(VSS) U6.113(VSS) U6.126(VSS) U6.135(VSS) U6.148(VSS) U6.158(VSS) Y1.2(GND) Y1.4(GND)
BOOT0: U6.166(BOOT0)
CAN_SHDN: R67.1
CAN_TX: R65.1 R69.1
CODEC_RST: R59.2
FDCAN2_RX: U6.92(PB12)
FDCAN2_SHDN: R67.2 U6.94(PB14)
FDCAN2_STB: R69.2 U6.95(PB15)
FDCAN2_TX: R65.2 U6.93(PB13)
I2C1_SCL: R61.1
I2C1_SDA: R63.1
I2C2_SCL: R90.1
I2C2_SDA: R91.1
JTRST: U6.162(PB4)
MCU_VBAT: C53.1 U6.6(VBAT)
MCU_VCAP: C51.1 C52.1 U6.81(VCAP) U6.125(VCAP)
MCU_VDDA: C49.1 C50.1 FB2.2 R87.2 U6.39(VDDA)
NRST: U6.31(~{RST})
OSC_IN: C80.1 U6.29(PH0-OSC_IN) Y1.3
OSC_OUT: R62.1 U6.30(PH1-OSC_OUT)
OSC_OUT_RES: C96.2 R62.2 Y1.1
PEDAL_MODE_SELECT: U6.56(PB0)
PEDAL_MUTE: U6.54(PC4)
PEDAL_ON/OFF: U6.55(PC5)
PITCH_DOWN: U6.53(PA7)
PITCH_UP: U6.52(PA6)
QSPI_CLK: R71.2
QSPI_CS: R86.1
QSPI_IO0: R68.2
QSPI_IO1: R70.2
QSPI_IO2: R66.2
QSPI_IO3: R64.2
RAM_A0: U6.16(PF0)
RAM_A1: U6.17(PF1)
RAM_A2: U6.18(PF2)
RAM_A3: U6.19(PF3)
RAM_A4: U6.20(PF4)
RAM_A5: U6.21(PF5)
RAM_A6: U6.60(PF12)
RAM_A7: U6.63(PF13)
RAM_A8: U6.64(PF14)
RAM_A9: U6.65(PF15)
RAM_A10: U6.66(PG0)
RAM_A11: U6.67(PG1)
RAM_BA0: U6.108(PG4)
RAM_BA1: U6.109(PG5)
RAM_CKE: U6.84(PH7)
RAM_CLK: U6.112(PG8)
RAM_D0: U6.104(PD14)
RAM_D1: U6.105(PD15)
RAM_D2: U6.142(PD0)
RAM_D3: U6.143(PD1)
RAM_D4: U6.68(PE7)
RAM_D5: U6.69(PE8)
RAM_D6: U6.70(PE9)
RAM_D7: U6.73(PE10)
RAM_D8: U6.74(PE11)
RAM_D9: U6.75(PE12)
RAM_D10: U6.76(PE13)
RAM_D11: U6.77(PE14)
RAM_D12: U6.78(PE15)
RAM_D13: U6.96(PD8)
RAM_D14: U6.97(PD9)
RAM_D15: U6.98(PD10)
RAM_D16: U6.85(PH8)
RAM_D17: U6.86(PH9)
RAM_D18: U6.87(PH10)
RAM_D19: U6.88(PH11)
RAM_D20: U6.89(PH12)
RAM_D21: U6.128(PH13)
RAM_D22: U6.129(PH14)
RAM_D23: U6.130(PH15)
RAM_D24: U6.131(PI0)
RAM_D25: U6.132(PI1)
RAM_D26: U6.133(PI2)
RAM_D27: U6.134(PI3)
RAM_D28: U6.175(PI6)
RAM_D29: U6.176(PI7)
RAM_D30: U6.11(PI9)
RAM_D31: U6.12(PI10)
RAM_DM0: U6.169(PE0)
RAM_DM1: U6.170(PE1)
RAM_DM2: U6.173(PI4)
RAM_DM3: U6.174(PI5)
RAM_NCAS: U6.160(PG15)
RAM_NCS: U6.83(PH6)
RAM_NRAS: U6.59(PF11)
RAM_NWE: U6.32(PC0)
SAI_FS_A: R83.2
SAI_MCLK_A: R82.2
SAI_SCK_A: R84.2
SAI_SD_A: R85.2
SAI_SD_B: U6.2(PE3)
STM_CODEC_RST: R59.1 U6.9(PC14-OSC32_IN)
STM_I2C1_SCL: R61.2 U6.164(PB6)
STM_I2C1_SDA: R63.2 U6.165(PB7)
STM_I2C2_SCL: R90.2 U6.45(PH4)
STM_I2C2_SDA: R91.2 U6.46(PH5)
STM_QSPI_CLK: R71.1 U6.58(PB2)
STM_QSPI_CS: R86.2 U6.79(PB10)
STM_QSPI_IO0: R68.1 U6.26(PF8)
STM_QSPI_IO1: R70.1 U6.27(PF9)
STM_QSPI_IO2: R66.1 U6.25(PF7)
STM_QSPI_IO3: R64.1 U6.24(PF6)
STM_SAI_FS_A: R83.1 U6.3(PE4)
STM_SAI_MCLK_A: R82.1 U6.1(PE2)
STM_SAI_SCK_A: R84.1 U6.4(PE5)
STM_SAI_SD_A: R85.1 U6.5(PE6)
SWCLK/TCK: U6.137(PA14)
SWDIO/TMS: U6.124(PA13)
SWO/TDO: U6.161(PB3)
TDI: U6.138(PA15)
USART6_RX: U6.116(PC7)
USART6_TX: R35.1 U6.115(PC6)
USART_TX: R35.2
USB_DM: R40.1
USB_DP: R41.1
USB_OTG_FS_DM: R40.2 U6.122(PA11)
USB_OTG_FS_DP: R41.2 U6.123(PA12)
USB_OTG_FS_VBUS: U6.120(PA9)
NetR87_1: R87.1 U6.38(VREF+)

Not connected (* = marked no-connect by the designer): U6 7(PI8) 8(PC13) 10(PC15-OSC32_OUT) 13(PI11) 28(PF10) 33(PC1) 34(PC2_C) 35(PC3_C) 40(PA0) 41(PA1) 42(PA2) 43(PH2) 44(PH3) 47(PA3) 50(PA4) 51(PA5) 57(PB1) 80(PB11) 99(PD11) 100(PD12) 101(PD13) 106(PG2) 107(PG3) 110(PG6) 111(PG7) 117(PC8) 118(PC9) 119(PA8) 121(PA10) 139(PC10) 140(PC11) 141(PC12) 144(PD2) 145(PD3) 146(PD4) 147(PD5) 150(PD6) 151(PD7) 152(PG9) 153(PG10) 154(PG11) 155(PG12) 156(PG13) 157(PG14) 163(PB5) 167(PB8) 168(PB9) 171(PDR_ON)

### Library data of the parts
C35 C51 C52 = CMP-001-00085-2: as C3 on sheet Analogue_IN
C36-C50 C53 C55-C57 = CMP-001-00084-2: MLCC 0402 50V / Samsung CL05B104KB54PNC
C80 C96 = CMP-001-00084-2: Capacitor, MLCC, 5.6pF, 50V, NPO, 5%, 0402, T=0,5mm
FB2 = CMP-06046-002300-1: as FB1 on sheet Power
R35 R40 R41 R59 R61-R71 R82-R87 R90 R91 = CMP-009-00178-3: Chip 0402 resistor
U6 = CMP-12105-000078-1: IC MCU 32BIT 2MB FLASH 176LQFP; Manufacturer: STMicroelectronics; Number Of I/Os: 140; Number Of Pwm Channels: 2; Standoff Height: 0.05mm; Number Of Uart Channels: 9; Frequency: 400MHz; Core Architecture: ARM Cortex-M7; Ram Size: 1MBytes; Max Supply Voltage: 3.6V; Number Of Timers/Counters: 20; Min Supply Voltage: 1.62V; Number Of I2C Channels: 4; Number Of Cores: 1; Max Junction Temp: +125°C; Data Bus Width: 32bits; Memory Size: 2MBytes; Number Of Adc Channels: 36; Number Of Spi Channels: 6; Interface: I2C,SPI,UART,USART,CAN,USB,LIN,IrDA,Ethernet,SMBus,Other; Number Of A/D Converters: 3; Digikey Description: IC MCU 32BIT 2MB FLASH 176LQFP; Temperature: -40°C to +125°C; Package: LQFP176-1T; RoHS: TRUE; Memory Type: FLASH; Device Class L3: Microcontrollers; Manufacturer Part Number: STM32H743IIT6; Mouser Description: MCU 32-Bit STM32 ARM Cortex M7 RISC 2MB Flash 1.8V/2.5V/3.3V 176-Pin LQFP Tray; Category: IC; Automotive: No; Ambient Temperature Range High: +85°C; Number Of Usb Channels: 2; ComponentLink2URL: https://www.st.com/resource/en/datasheet/stm32h743ii.pdf; Lead Free: Yes; Ambient Temperature Range Low: -40°C; ComponentLink2Description: Datasheet; Device Class L2: Embedded Processors and Controllers; Octopart: https://octopart.com/stm32h743iit6-stmicroelectronics-76372526; Device Class L1: Integrated Circuits (ICs); Height: 1.6mm; Temperature Range Low: -40°C; Temperature Range High: +125°C; Number Of Ethernet Channels: 1; Ipc Land Pattern Name: QFP50P2600X2600X160-176
Y1 = CMP-200220-000017-1: NX2016SA 25MHz / Crystal 25MHz, 6pF, +-20ppm, 80ohms max, SMD; Frequency: 32MHz; Load Capacitance: 8pF; ESR (Equivalent Series Resistance): 60R; Ratings: AEC-Q200; Mount: Surface Mount; Case/Package: SMD/SMT; Packaging: Tape and Reel; Min Operating Temperature: -40°C; Max Operating Temperature: 125°C

## Sheet Codec.SchDoc
size A4; SheetNumber: 6; SheetTotal: 8
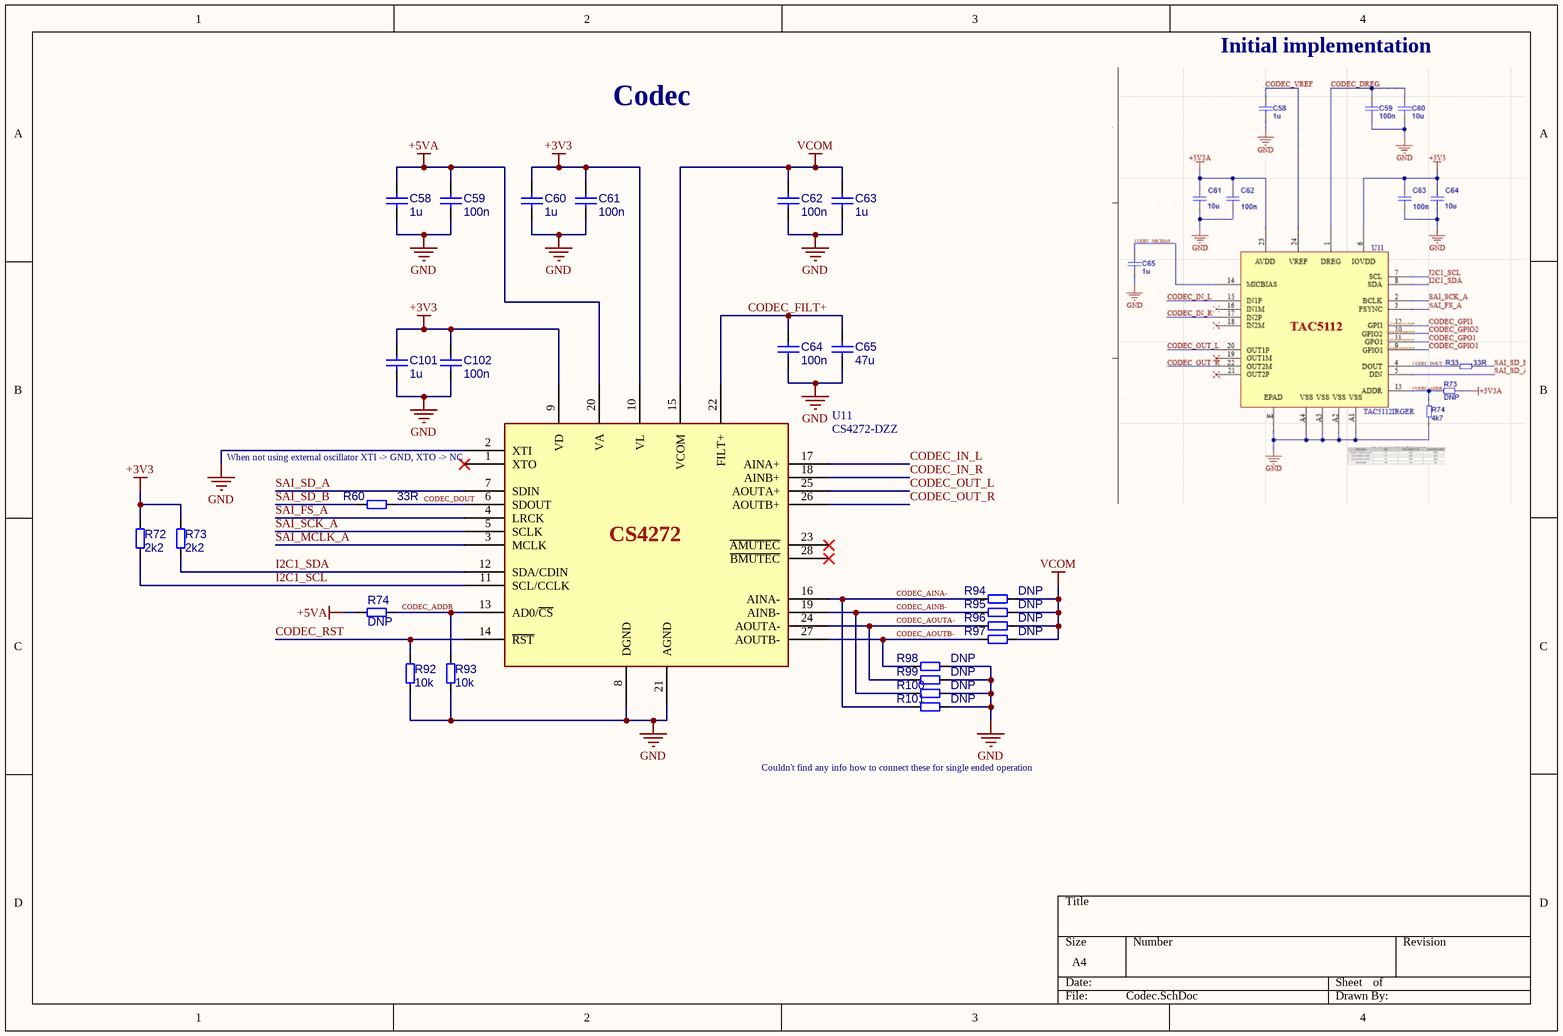
[diagram p5: Codec.SchDoc]

### Parts
C58  1u  [C_0402]
C59  100n  [CAPC1005X50N_0402]
C60  1u  [C_0402]
C61  100n  [CAPC1005X50N_0402]
C62  100n  [CAPC1005X50N_0402]
C63  1u  [C_0402]
C64  100n  [CAPC1005X50N_0402]
C65  47u  [C_1210]
C101  1u  [C_0402]
C102  100n  [CAPC1005X50N_0402]
R60  33R  [R_0402]
R72  2k2  [R_0603]
R73  2k2  [R_0603]
R74  DNP  [R_0603]
R92  10k  [R_0603]
R93  10k  [R_0603]
R94  DNP  [R_0402]
R95  DNP  [R_0402]
R96  DNP  [R_0402]
R97  DNP  [R_0402]
R98  DNP  [R_0402]
R99  DNP  [R_0402]
R100  DNP  [R_0402]
R101  DNP  [R_0402]
U11  CS4272-DZZ  [TSSOP-28_CS4272]

### Nets
+3V3: C60.1 C61.1 C101.1 C102.1 R72.2 R73.2 U11.9(VD) U11.10(VL)
+5VA: C58.1 C59.1 R74.2 U11.20(VA)
GND: C58.2 C59.2 C60.2 C61.2 C62.2 C63.2 C64.2 C65.1 C101.2 C102.2 R92.1 R93.1 R98.2 R99.2 R100.2 R101.2 U11.2(XTI) U11.8(DGND) U11.21(AGND)
VCOM: C62.1 C63.1 R94.2 R95.2 R96.2 R97.2 U11.15(VCOM)
CODEC_ADDR: R74.1 R93.2 U11.13(AD0/~{CS})
CODEC_AINA-: R94.1 R101.1 U11.16(AINA-)
CODEC_AINB-: R95.1 R100.1 U11.19(AINB-)
CODEC_AOUTA-: R96.1 R99.1 U11.24(AOUTA-)
CODEC_AOUTB-: R97.1 R98.1 U11.27(AOUTB-)
CODEC_DOUT: R60.2 U11.6(SDOUT)
CODEC_FILT+: C64.1 C65.2 U11.22(FILT+)
CODEC_IN_L: U11.17(AINA+)
CODEC_IN_R: U11.18(AINB+)
CODEC_OUT_L: U11.25(AOUTA+)
CODEC_OUT_R: U11.26(AOUTB+)
CODEC_RST: R92.2 U11.14(~{RST})
I2C1_SCL: R72.1 U11.11(SCL/CCLK)
I2C1_SDA: R73.1 U11.12(SDA/CDIN)
SAI_FS_A: U11.4(LRCK)
SAI_MCLK_A: U11.3(MCLK)
SAI_SCK_A: U11.5(SCLK)
SAI_SD_A: U11.7(SDIN)
SAI_SD_B: R60.1

Not connected (* = marked no-connect by the designer): U11 1(XTO)* 23(~{AMUTEC})* 28(~{BMUTEC})*

### Notes on the sheet
- Codec
- Initial implementation
- (near U11) When not using external oscillator XTI -> GND, XTO -> NC
- Couldn't find any info how to connect these for single ended operation
- (in symbol CMP-015-00011-3) CS4272

### Library data of the parts
C58 C60 C63 C101 = CMP-001-00085-2: MLCC 0603
C59 C61 C62 C64 C102 = CMP-001-00084-2: MLCC 0402
C65 = CMP-001-00088-1: as C88 on sheet Power
R60 R94-R101 = CMP-009-00178-3: Chip 0402 resistor
R72-R74 R92 R93 = CMP-009-00177-7: Chip resistor 0603
U11 = CMP-015-00011-3: PCM Audio Codec, 2ADC/2DAC Ch, Automotive, 28-Pin TSSOP Tube; Number of Circuits: 1; Max Supply Current: 53mA; Sampling Rate: 192ksps; Number of Bits: 24; Number of A/D Converters: 2; Max Supply Voltage: 5.25V; Resolution: 3B; Interface: I2C, SPI; Signal to Noise Ratio (SNR): 114dB; Min Supply Voltage: 4.75V; Nominal Supply Current: 45mA; Pins: 28; Number of Terminals: 28; Introduction Date: 2003-01-21; RoHS: Compliant; Terminal Pitch: 650µm; Min Operating Temperature: -40°C; LTB Date: 2021-04-19; LTD Date: 2021-04-19; Type: General Purpose; Temperature Grade: Industrial; Max Operating Temperature: 85°C; Number of Channels: 2; Mounting Technology: Surface Mount; Height - Seated (Max): 1.2mm; Termination: SMD/SMT; Length: 9.7mm; Number of D/A Converters: 2; Lifecycle Status: Obsolete; REACH SVHC: Unaffected; Contact Plating: Tin; Width: 4.4mm; Case/Package: TSSOP

## Sheet Memory.SchDoc
size A4; SheetNumber: 7; SheetTotal: 8
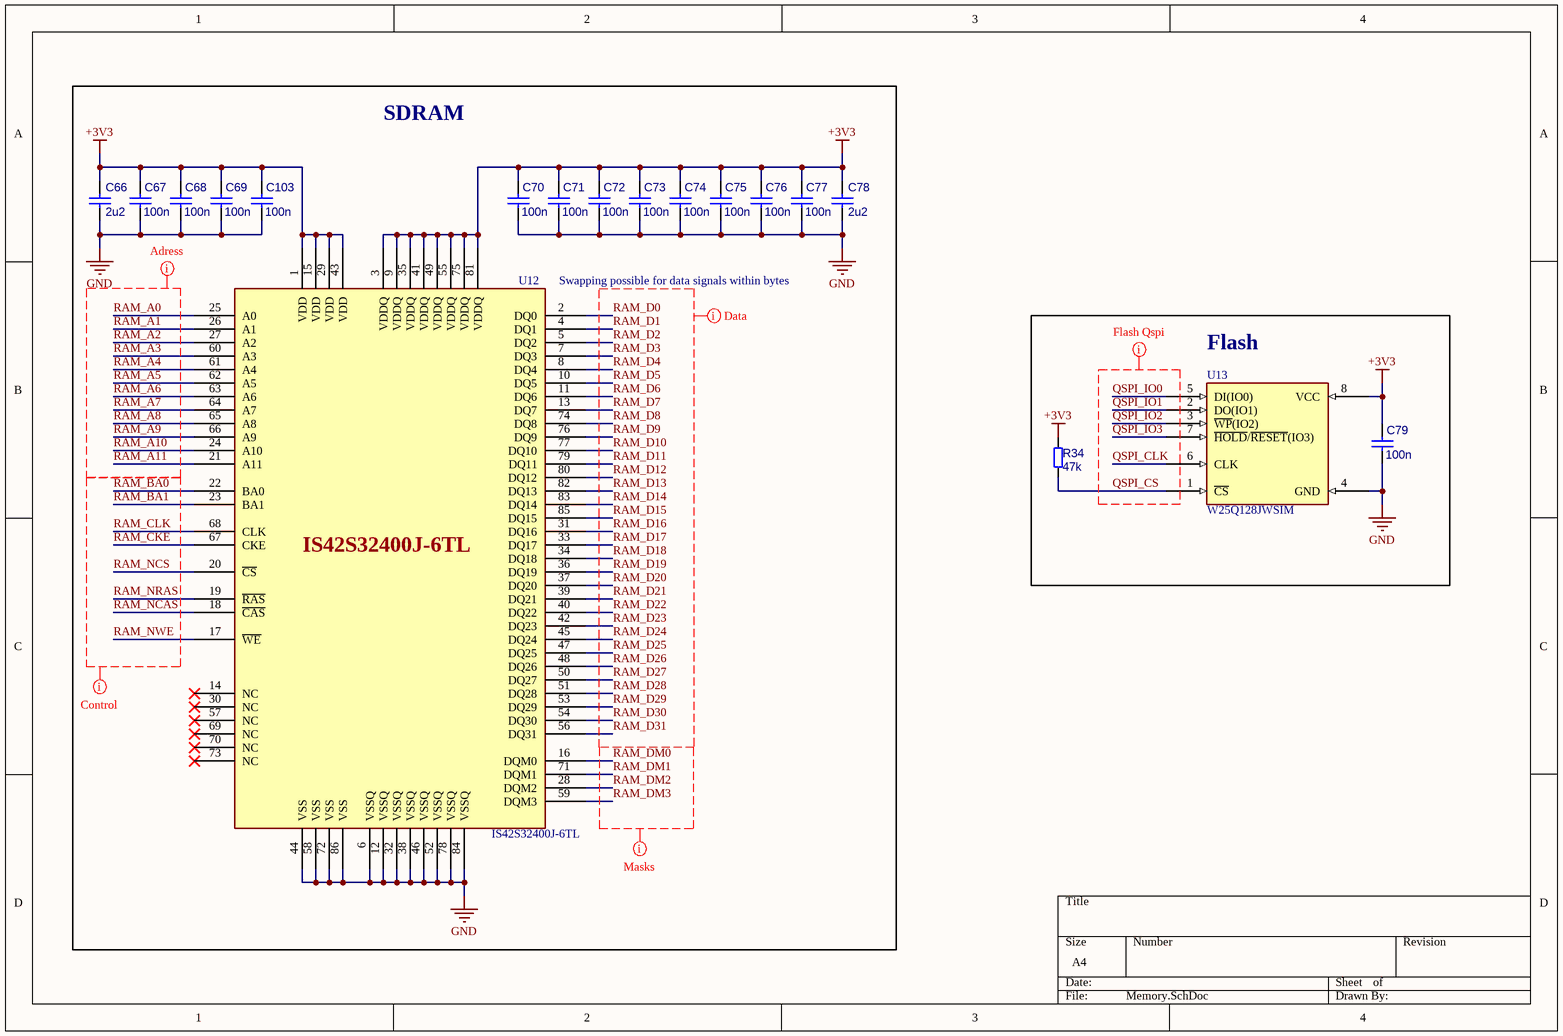
[diagram p6: Memory.SchDoc]

### Parts
C66  2u2  [C_0402]
C67  100n  [CAPC1005X50N_0402]
C68  100n  [CAPC1005X50N_0402]
C69  100n  [CAPC1005X50N_0402]
C70  100n  [CAPC1005X50N_0402]
C71  100n  [CAPC1005X50N_0402]
C72  100n  [CAPC1005X50N_0402]
C73  100n  [CAPC1005X50N_0402]
C74  100n  [CAPC1005X50N_0402]
C75  100n  [CAPC1005X50N_0402]
C76  100n  [CAPC1005X50N_0402]
C77  100n  [CAPC1005X50N_0402]
C78  2u2  [C_0402]
C79  100n  [CAPC1005X50N_0402]
C103  100n  [CAPC1005X50N_0402]
R34  47k  [R_0603]
U12  IS42S32400J-6TL  [TSOP-II-86_IS42S32400J-6TL]
U13  W25Q128JWSIM  [SOIC-8_W25Q128JWSIM]

### Blocks framed on the sheet
SDRAM: C66-C78 C103 U12
Flash: C79 R34 U13

### Nets
+3V3: C66.1 C67.1 C68.1 C69.1 C70.1 C71.1 C72.1 C73.1 C74.1 C75.1 C76.1 C77.1 C78.1 C79.1 C103.1 R34.2 U12.1(VDD) U12.3(VDDQ) U12.9(VDDQ) U12.15(VDD) U12.29(VDD) U12.35(VDDQ) U12.41(VDDQ) U12.43(VDD) U12.49(VDDQ) U12.55(VDDQ) U12.75(VDDQ) U12.81(VDDQ) U13.8(VCC)
GND: C66.2 C67.2 C68.2 C69.2 C70.2 C71.2 C72.2 C73.2 C74.2 C75.2 C76.2 C77.2 C78.2 C79.2 C103.2 U12.6(VSSQ) U12.12(VSSQ) U12.32(VSSQ) U12.38(VSSQ) U12.44(VSS) U12.46(VSSQ) U12.52(VSSQ) U12.58(VSS) U12.72(VSS) U12.78(VSSQ) U12.84(VSSQ) U12.86(VSS) U13.4(GND)
QSPI_CLK: U13.6(CLK)
QSPI_CS: R34.1 U13.1(~{CS})
QSPI_IO0: U13.5(DI(IO0))
QSPI_IO1: U13.2(DO(IO1))
QSPI_IO2: U13.3(~{WP}(IO2))
QSPI_IO3: U13.7(~{HOLD}/~{RESET}(IO3))
RAM_A0: U12.25(A0)
RAM_A1: U12.26(A1)
RAM_A2: U12.27(A2)
RAM_A3: U12.60(A3)
RAM_A4: U12.61(A4)
RAM_A5: U12.62(A5)
RAM_A6: U12.63(A6)
RAM_A7: U12.64(A7)
RAM_A8: U12.65(A8)
RAM_A9: U12.66(A9)
RAM_A10: U12.24(A10)
RAM_A11: U12.21(A11)
RAM_BA0: U12.22(BA0)
RAM_BA1: U12.23(BA1)
RAM_CKE: U12.67(CKE)
RAM_CLK: U12.68(CLK)
RAM_D0: U12.2(DQ0)
RAM_D1: U12.4(DQ1)
RAM_D2: U12.5(DQ2)
RAM_D3: U12.7(DQ3)
RAM_D4: U12.8(DQ4)
RAM_D5: U12.10(DQ5)
RAM_D6: U12.11(DQ6)
RAM_D7: U12.13(DQ7)
RAM_D8: U12.74(DQ8)
RAM_D9: U12.76(DQ9)
RAM_D10: U12.77(DQ10)
RAM_D11: U12.79(DQ11)
RAM_D12: U12.80(DQ12)
RAM_D13: U12.82(DQ13)
RAM_D14: U12.83(DQ14)
RAM_D15: U12.85(DQ15)
RAM_D16: U12.31(DQ16)
RAM_D17: U12.33(DQ17)
RAM_D18: U12.34(DQ18)
RAM_D19: U12.36(DQ19)
RAM_D20: U12.37(DQ20)
RAM_D21: U12.39(DQ21)
RAM_D22: U12.40(DQ22)
RAM_D23: U12.42(DQ23)
RAM_D24: U12.45(DQ24)
RAM_D25: U12.47(DQ25)
RAM_D26: U12.48(DQ26)
RAM_D27: U12.50(DQ27)
RAM_D28: U12.51(DQ28)
RAM_D29: U12.53(DQ29)
RAM_D30: U12.54(DQ30)
RAM_D31: U12.56(DQ31)
RAM_DM0: U12.16(DQM0)
RAM_DM1: U12.71(DQM1)
RAM_DM2: U12.28(DQM2)
RAM_DM3: U12.59(DQM3)
RAM_NCAS: U12.18(~{CAS})
RAM_NCS: U12.20(~{CS})
RAM_NRAS: U12.19(~{RAS})
RAM_NWE: U12.17(~{WE})

Not connected (* = marked no-connect by the designer): U12 14(NC)* 30(NC)* 57(NC)* 69(NC)* 70(NC)* 73(NC)*

### Layout directives
net class SDRAM_DATA: RAM_D0, RAM_D1, RAM_D2, RAM_D3, RAM_D4, RAM_D5, RAM_D6, RAM_D7, RAM_D8, RAM_D9, RAM_D10, RAM_D11, RAM_D12, RAM_D13, RAM_D14, RAM_D15, RAM_D16, RAM_D17, RAM_D18, RAM_D19, RAM_D20, RAM_D21, RAM_D22, RAM_D23, RAM_D24, RAM_D25, RAM_D26, RAM_D27, RAM_D28, RAM_D29, RAM_D30, RAM_D31
net class SDRAM_ADR: RAM_A0, RAM_A1, RAM_A2, RAM_A3, RAM_A4, RAM_A5, RAM_A6, RAM_A7, RAM_A8, RAM_A9, RAM_A10, RAM_A11
net class SDRAM_CTRL: RAM_BA0, RAM_BA1, RAM_CKE, RAM_CLK, RAM_NCAS, RAM_NCS, RAM_NRAS, RAM_NWE
net class SDRAM_MASK: RAM_DM0, RAM_DM1, RAM_DM2, RAM_DM3
net class QSPI: QSPI_CLK, QSPI_CS, QSPI_IO0, QSPI_IO1, QSPI_IO2, QSPI_IO3

### Notes on the sheet
- (near U12) Swapping possible for data signals within bytes

### Library data of the parts
C66 C78 = CMP-001-00085-2: as C3 on sheet Analogue_IN
C67-C77 C79 C103 = CMP-001-00084-2: MLCC 0402 50V / Samsung CL05B104KB54PNC
R34 = CMP-009-00177-7: Chip 0603
U12 = CMP-019-00064-5: 128M, 3.3V, Sdram, 4Mx32, 166Mhz, 86 Pin;; Min Supply Voltage: 3V; Number of Ports: 1; Access Time: 5.4ns; Max Supply Voltage: 3.6V; Length: 22.22mm; Nominal Supply Voltage (DC): 3.3V; Min Operating Temperature: 0°C; Country of Origin: Mainland China, Taiwan; China RoHS: Compliant; Width: 10.16mm; Lifecycle Status: Production; Harmonized Tariff Schedule (HTS) Code: 8542.32.00.02; Export Control Classification Number (ECCN) Code: EAR99; RoHS: Compliant; Number of Terminals: 86; Terminal Pitch: 500µm; Max Operating Temperature: 70°C; Temperature Grade: Commercial; REACH SVHC: Unaffected; Number of Circuits: 1; Height - Seated (Max): 1.2mm; Introduction Date: 2017-05-09
U13 = CMP-019-00065-3: NOR Flash Serial (SPI, Dual SPI, Quad SPI) 1.8V 128M-bit 16M x 8 8-Pin SOIC Bulk; Max Supply Voltage: 1.95V; Number of Circuits: 1; Max Supply Current: 20mA; Min Supply Voltage: 1.7V; Harmonized Tariff Schedule (HTS) Code: 8542.32.00.51; Min Operating Temperature: -40°C; RoHS: Compliant; Schedule B: 8542320070; Width: 5.28mm; Terminal Pitch: 1.27mm; REACH SVHC: Unaffected; China RoHS: Compliant; Export Control Classification Number (ECCN) Code: EAR99; Temperature Grade: Industrial; Country of Origin: Taiwan; Max Operating Temperature: 85°C; Number of Terminals: 8; Length: 5.28mm; Case/Package: SOP; Lifecycle Status: Production; Nominal Supply Voltage (DC): 1.8V; Memory Format: FLASH; Introduction Date: 2019-05-23; Height - Seated (Max): 2.16mm